# Altium project Pump_Controller.PrjPcb
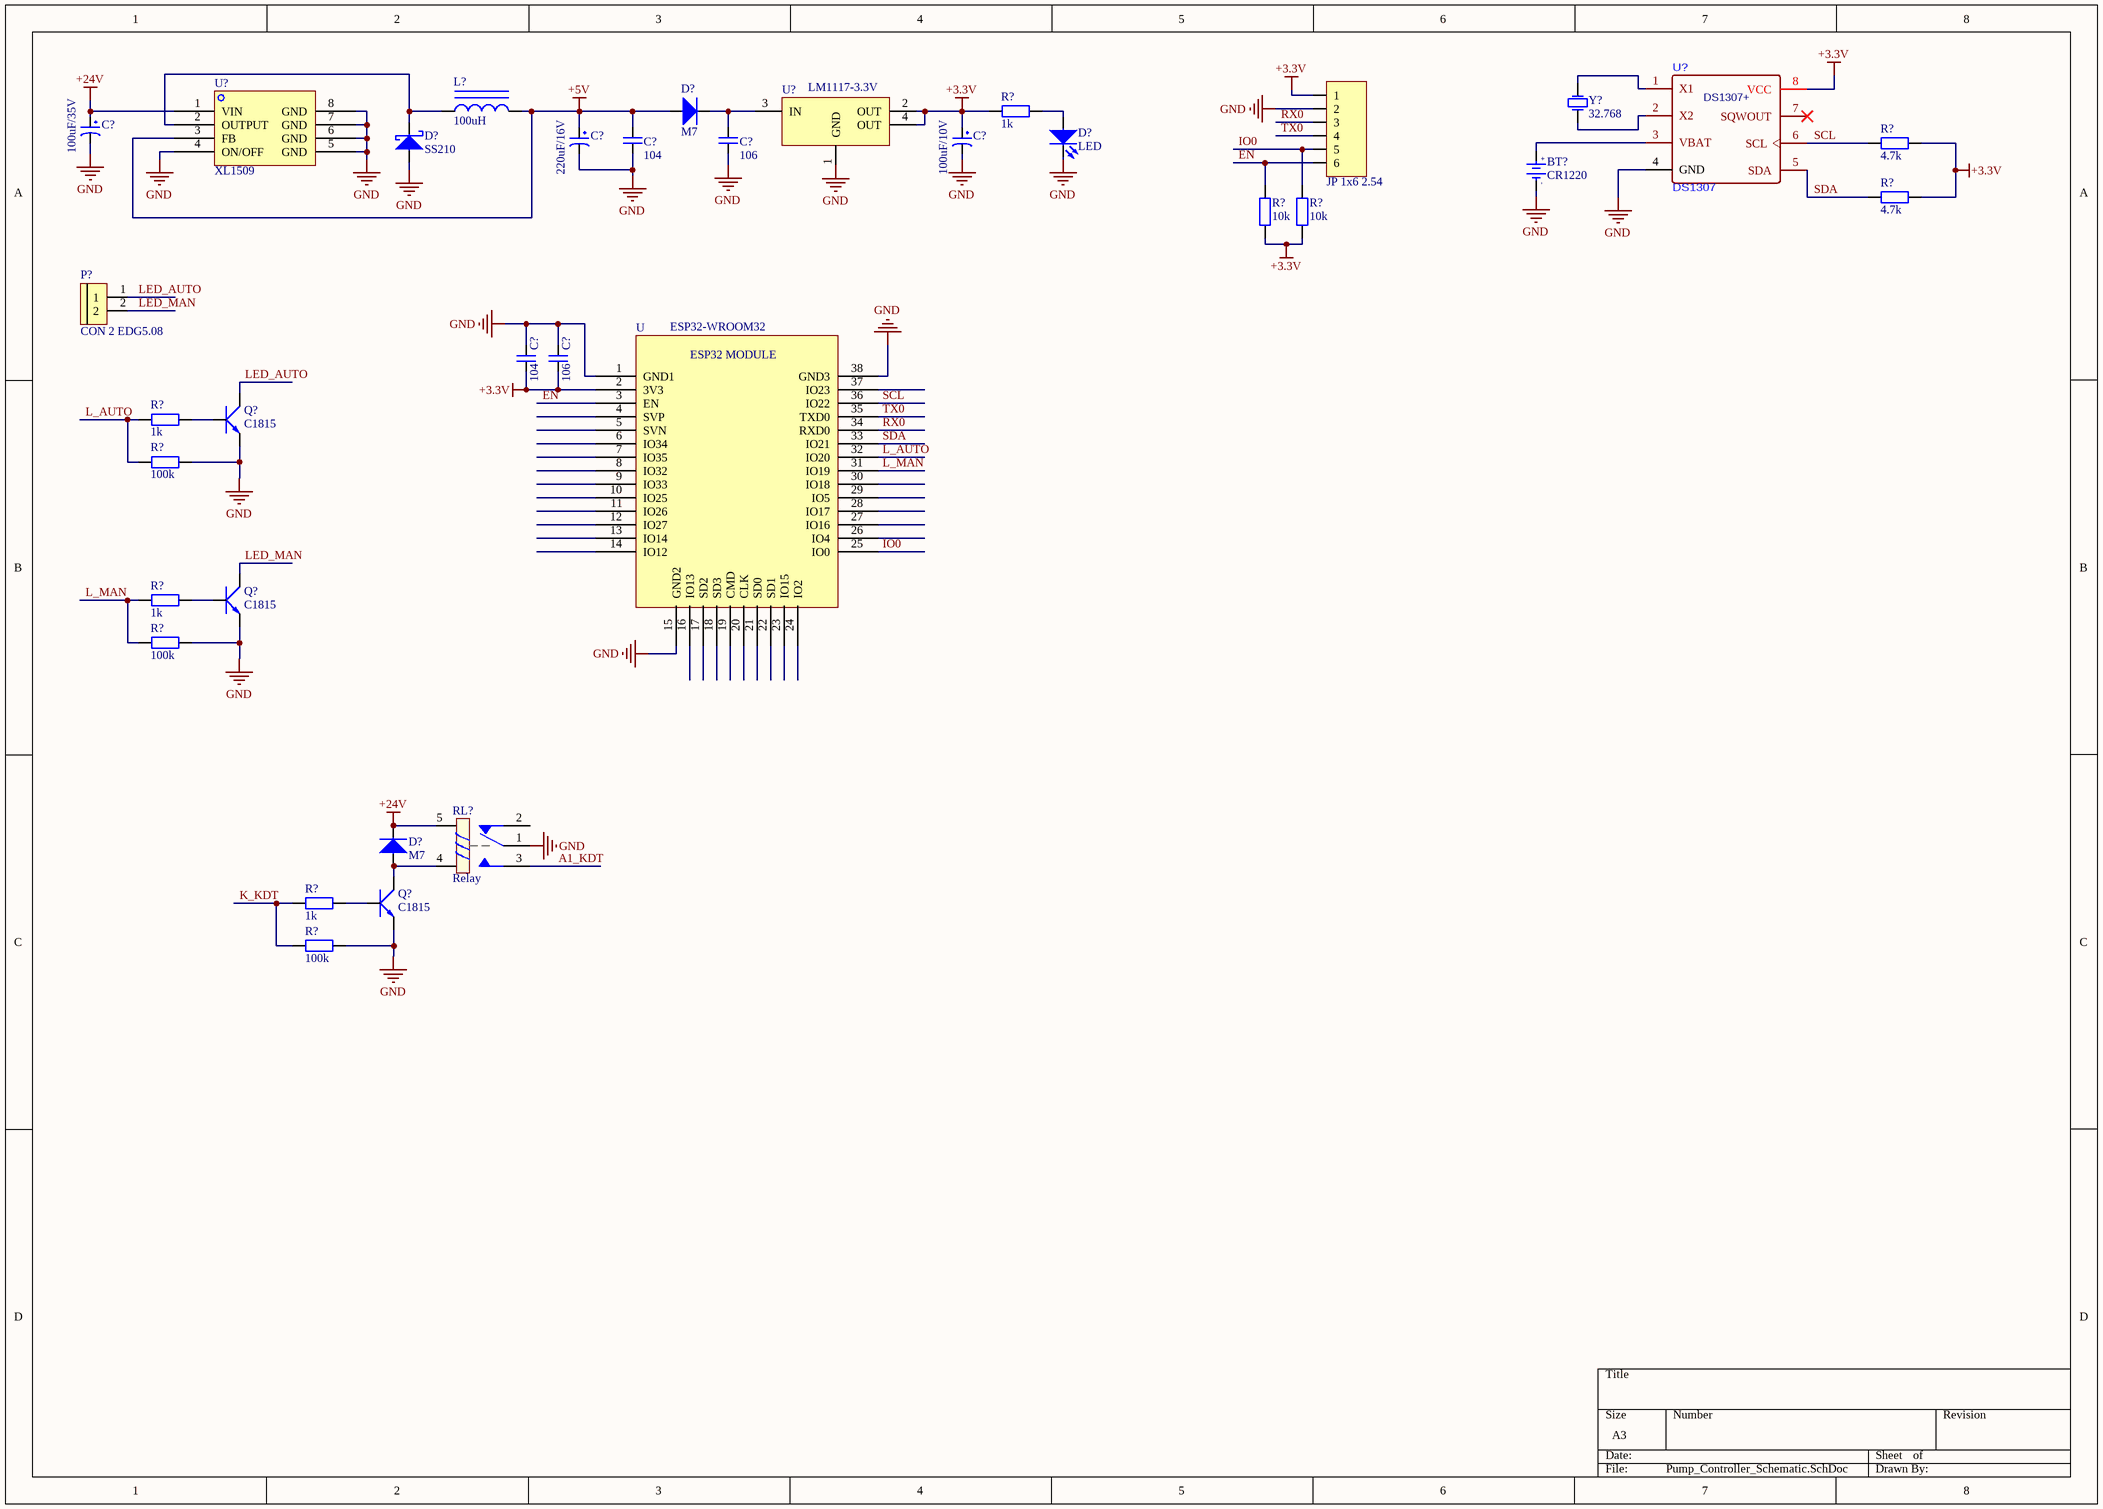
[diagram p0: Pump_Controller_Schematic.SchDoc]
1 sheet, 35 parts. Net scope: global (net labels, ports and power ports of the same name join across sheets).

## Sheet Pump_Controller_Schematic.SchDoc
size A3; SheetNumber: 1; SheetTotal: 1

### Parts
(Parts that share a designator on the sheet are numbered #1, #2 ... from top to bottom, then left to right.)
BT?  CR1220  [DE PIN CR1220]
C?#1  100uF/35V  [CAP SMD ALUMINUM D8]
C?#2  220uF/16V  [CAP SMD ALUMINUM D]
C?#3  104  [SM-0805]
C?#4  106  [SM-0805]
C?#5  100uF/10V  [CAP SMD ALUMINUM D]
C?#6  104  [SM-0805]
C?#7  106  [SM-0805]
D?#1  M7  [DO-214AC]
D?#2  LED  [LED-3MM RED]
D?#3  SS210  [DO-214AC]
D?#4  M7  [DO-214AC]
JP?  JP 1x6 2.54  [JP 1x6 DT]
L?  100uH  [INDUCTOR SMD 7342 7.3X7.3X4.2mm]
P?  CON 2 EDG5.08  [CON 2 2EDG5.08]
Q?#1  C1815  [SOT23B]
Q?#2  C1815  [SOT23B]
Q?#3  C1815  [SOT23B]
R?#1  1k  [RESISTOR SMD 0805]
R?#2  4.7k  [RESISTOR SMD 0805]
R?#3  4.7k  [RESISTOR SMD 0805]
R?#4  10k  [RESISTOR SMD 0805]
R?#5  10k  [RESISTOR SMD 0805]
R?#6  1k  [RESISTOR SMD 0805]
R?#7  100k  [RESISTOR SMD 0805]
R?#8  1k  [RESISTOR SMD 0805]
R?#9  100k  [RESISTOR SMD 0805]
R?#10  1k  [RESISTOR SMD 0805]
R?#11  100k  [RESISTOR SMD 0805]
RL?  Relay  [Relay 5 Chan SRD]
U  ESP32-WROOM32  [ESP32-WROOM32]
U?#1  LM1117-3.3V  [SOT223-4N]
U?#2  DS1307  [SOP 8]
U?#3  XL1509  [SOP8]
Y?  32.768  [THACH ANH DAN 3215]

### Nets
+3.3V: C?#5.1 C?#6.1 C?#7.1 JP?.1 R?#1.1 R?#2.1 R?#3.1 R?#4.1 R?#5.1 U.2(3V3) U?#1.2(OUT) U?#1.4(OUT) U?#2.8(VCC)
+5V: C?#2.1 C?#3.2 D?#1.1 L?.2 U?#3.3(FB)
+24V: C?#1.1 D?#4.2 RL?.5 U?#3.1(VIN)
GND: BT?.2(GND) C?#1.2 C?#2.2 C?#3.1 C?#4.1 C?#5.2 C?#6.2 C?#7.2 D?#2.2 D?#3.1 JP?.2 Q?#1.1(E) Q?#2.1(E) Q?#3.1(E) R?#7.2 R?#9.2 R?#11.2 RL?.1 U.1(GND1) U.15(GND2) U.38(GND3) U?#1.1(GND) U?#2.4(GND) U?#3.4(ON/OFF) U?#3.5(GND) U?#3.6(GND) U?#3.7(GND) U?#3.8(GND)
A1_KDT: RL?.3
EN: JP?.6 R?#4.2 U.3(EN)
IO0: JP?.5 R?#5.2 U.25(IO0)
K_KDT: R?#10.1 R?#11.1
L_AUTO: R?#6.1 R?#7.1 U.32(IO20)
L_MAN: R?#8.1 R?#9.1 U.31(IO19)
LED_AUTO: P?.1 Q?#1.2(C)
LED_MAN: P?.2 Q?#2.2(C)
RX0: JP?.3 U.34(RXD0)
SCL: R?#2.2 U.36(IO22) U?#2.6(SCL)
SDA: R?#3.2 U.33(IO21) U?#2.5(SDA)
TX0: JP?.4 U.35(TXD0)
NetBT?_1: BT?.1(+3V) U?#2.3(VBAT)
NetC?#4_2: C?#4.2 D?#1.2 U?#1.3(IN)
NetD?#2_1: D?#2.1 R?#1.2
NetD?#3_2: D?#3.2 L?.1 U?#3.2(OUTPUT)
NetD?#4_1: D?#4.1 Q?#3.2(C) RL?.4
NetQ?#1_3: Q?#1.3(B) R?#6.2
NetQ?#2_3: Q?#2.3(B) R?#8.2
NetQ?#3_3: Q?#3.3(B) R?#10.2
NetU?#2_1: U?#2.1(X1) Y?.1(OSC1)
NetU?#2_2: U?#2.2(X2) Y?.2(OSC2)

Not connected (* = marked no-connect by the designer): RL? 2; U 4(SVP) 5(SVN) 6(IO34) 7(IO35) 8(IO32) 9(IO33) 10(IO25) 11(IO26) 12(IO27) 13(IO14) 14(IO12) 16(IO13) 17(SD2) 18(SD3) 19(CMD) 20(CLK) 21(SD0) 22(SD1) 23(IO15) 24(IO2) 26(IO4) 27(IO16) 28(IO17) 29(IO5) 30(IO18) 37(IO23); U?#2 7(SQWOUT)*

### Notes on the sheet
- (in symbol De pin CR1220 SMD) +; -
- (in symbol DS1307) DS1307+
- (in symbol ESP32-WROOM32) ESP32 MODULE

### Library data of the parts
BT? = De pin CR1220 SMD: CR1220 SMD; Ten: Đế PIN CR1220 SMD; Ma_Hang: MH000833
C?#1 C?#2 C?#5 = Cap_Polar
C?#3 C?#4 C?#6 C?#7 = Cap_Non-Polar
D?#1 D?#4 = Diode Standard: Part Number: LED 3 ly Single Colour; Pricing: *
D?#2 = LED: LED Single; Value: LED 3 ly Single Colour
D?#3 = Diode Schottky: Part Number: LED 3 ly Single Colour; Pricing: *
JP? = JP 1x6 2.54 Duc Thang: Cắm; Ten_Linh_Kien: Jump Đơn Đực 2.54MM 1x40P Thẳng 11MM; Don_Vi: Con; Ma_Hang: MH000903; Ghi_Chu: *; Kieu_Chan: *; Chung_Loai: Cắm
L? = Inductor Iron: Magnetic-Core Inductor; Value: 150 mH
P? = CON 2 EDG5.08: Cắm; Ten_Linh_Kien: CON 2 2EDG5.08-2P 5.08MM ( Xanh Cong); Ma_Hang: MH000759; Ghi_Chu: *; Don_Vi: Con; Kieu_Chan: *; Chung_Loai: Cắm
Q?#1-Q?#3 = C1815: NPN 600mW, ECB; Value: C1815
R?#1-R?#11 = Resistor
RL? = Relay 5 Chan SRD: Relay 5 Chan; Ma_Hang: MH009374; Ten: Relay 5V10A SRD-05VDC-SL-C Chính Hãng
U = ESP32-WROOM32: ESP32 MCU
U?#1 = LM1117: 800mA Low-Dropout Linear Regulator; Creator: Nguyen Ba Bien; Website: http://group3i.net
U?#2 = DS1307: C5145427
U?#3 = XL1509: IC power sop8
Y? = Thach Anh SMD 3225: C700805; Chung_Loai: Dán; Ten_Linh_Kien: Thạch Anh 16Mhz SMD5032; Ma_Hang: MH001979; Don_Vi: Con; Ghi_Chu: *; Kieu_Chan: *